# Altium project CH32V307VCT6.PrjPcb
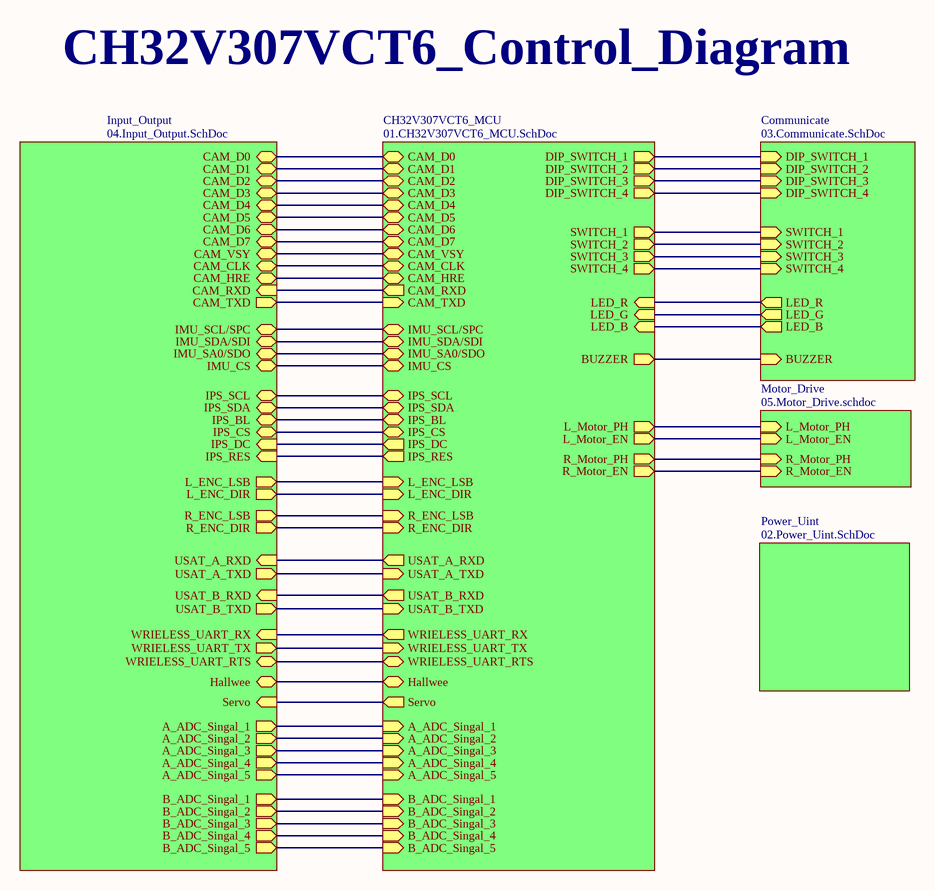
[diagram p0: 00.CH32V307VCT6.SchDoc]
6 sheets, 168 parts. Net scope: hierarchical (ports join the sheet entries above them; power ports are global).
Board file: CH32V307VCT6.PcbDoc
Sheets:
  00.CH32V307VCT6.SchDoc
    CH32V307VCT6_MCU = 01.CH32V307VCT6_MCU.SchDoc
    Communicate = 03.Communicate.SchDoc
    Input_Output = 04.Input_Output.SchDoc
    Power_Uint = 02.Power_Uint.SchDoc
    Motor_Drive = 05.Motor_Drive.schdoc

## Sheet 00.CH32V307VCT6.SchDoc: 00.CH32V307VCT6_Diagram
size A4; Organization: Altium Limited; Address1: L3, 12a Rodborough Rd; Address2: Frenchs Forest; Address3: NSW; Address4: Australia 2086; Revision: V1; SheetNumber: 1; SheetTotal: 6; Project: CH32V307VCT6

### Sub-sheets
CH32V307VCT6_MCU = 01.CH32V307VCT6_MCU.SchDoc: CAM_D0 (bidir), CAM_D1 (bidir), CAM_D2 (bidir), CAM_D3 (bidir), CAM_D5 (bidir), CAM_D4 (bidir), CAM_D6 (bidir), CAM_D7 (bidir), CAM_CLK (bidir), CAM_TXD (in), CAM_RXD (out), CAM_HRE (bidir), CAM_VSY (bidir), IMU_SCL/SPC (bidir), IMU_SDA/SDI (bidir), IMU_SA0/SDO (bidir), IMU_CS (bidir), IPS_SCL (bidir), IPS_RES (out), IPS_SDA (bidir), IPS_CS (bidir), IPS_BL (bidir), IPS_DC (out), L_ENC_LSB (in), L_ENC_DIR (in), R_ENC_LSB (in), R_ENC_DIR (in), DIP_SWITCH_1 (out), DIP_SWITCH_2 (out), DIP_SWITCH_3 (out), DIP_SWITCH_4 (out), SWITCH_1 (out), SWITCH_2 (out), SWITCH_3 (out), SWITCH_4 (out), LED_R (in), LED_G (in), LED_B (in), BUZZER (out), L_Motor_PH (out), L_Motor_EN (out), R_Motor_PH (out), R_Motor_EN (out), USAT_A_TXD (in), USAT_A_RXD (out), USAT_B_TXD (in), USAT_B_RXD (out), WRIELESS_UART_TX (in), WRIELESS_UART_RX (out), WRIELESS_UART_RTS (bidir), Hallwee (bidir), A_ADC_Singal_1 (in), A_ADC_Singal_2 (in), A_ADC_Singal_3 (in), A_ADC_Singal_4 (in), A_ADC_Singal_5 (in), B_ADC_Singal_1 (in), B_ADC_Singal_2 (in), B_ADC_Singal_3 (in), B_ADC_Singal_4 (in), B_ADC_Singal_5 (in), Servo (out)
Communicate = 03.Communicate.SchDoc: DIP_SWITCH_3 (in), DIP_SWITCH_4 (in), DIP_SWITCH_1 (in), DIP_SWITCH_2 (in), SWITCH_3 (in), SWITCH_4 (in), SWITCH_1 (in), SWITCH_2 (in), LED_R (out), LED_G (out), LED_B (out), BUZZER (in)
Input_Output = 04.Input_Output.SchDoc: CAM_D0 (bidir), CAM_D1 (bidir), CAM_D2 (bidir), CAM_D3 (bidir), CAM_D5 (bidir), CAM_D4 (bidir), CAM_D6 (bidir), CAM_D7 (bidir), IMU_SCL/SPC (bidir), CAM_CLK (bidir), CAM_TXD (out), CAM_RXD (in), CAM_HRE (bidir), CAM_VSY (bidir), IMU_SDA/SDI (bidir), IMU_SA0/SDO (bidir), IMU_CS (bidir), L_ENC_DIR (out), R_ENC_DIR (out), R_ENC_LSB (out), IPS_SCL (bidir), L_ENC_LSB (out), IPS_RES (in), IPS_SDA (bidir), IPS_CS (bidir), IPS_BL (bidir), IPS_DC (in), USAT_A_RXD (in), USAT_A_TXD (out), USAT_B_RXD (in), USAT_B_TXD (out), WRIELESS_UART_RX (in), WRIELESS_UART_TX (out), WRIELESS_UART_RTS (bidir), Hallwee (bidir), A_ADC_Singal_1 (out), A_ADC_Singal_2 (out), A_ADC_Singal_3 (out), A_ADC_Singal_4 (out), A_ADC_Singal_5 (out), B_ADC_Singal_1 (out), B_ADC_Singal_2 (out), B_ADC_Singal_3 (out), B_ADC_Singal_4 (out), B_ADC_Singal_5 (out), Servo (in)
Motor_Drive = 05.Motor_Drive.schdoc: L_Motor_PH (in), L_Motor_EN (in), R_Motor_PH (in), R_Motor_EN (in)
Power_Uint = 02.Power_Uint.SchDoc: no entries

### Nets
ADC0_PA0: sheet CH32V307VCT6_MCU/B_ADC_Singal_2, sheet Input_Output/B_ADC_Singal_2
ADC1_PA1: sheet CH32V307VCT6_MCU/B_ADC_Singal_1, sheet Input_Output/B_ADC_Singal_1
ADC7_PA7: sheet CH32V307VCT6_MCU/A_ADC_Singal_5, sheet Input_Output/A_ADC_Singal_5
ADC8_PB0: sheet CH32V307VCT6_MCU/A_ADC_Singal_2, sheet Input_Output/A_ADC_Singal_2
ADC9_PB1: sheet CH32V307VCT6_MCU/A_ADC_Singal_1, sheet Input_Output/A_ADC_Singal_1
ADC11_PC1: sheet CH32V307VCT6_MCU/B_ADC_Singal_5, sheet Input_Output/B_ADC_Singal_5
ADC12_PC2: sheet CH32V307VCT6_MCU/B_ADC_Singal_3, sheet Input_Output/B_ADC_Singal_3
ADC13_PC3: sheet CH32V307VCT6_MCU/B_ADC_Singal_4, sheet Input_Output/B_ADC_Singal_4
ADC14_PC4: sheet CH32V307VCT6_MCU/A_ADC_Singal_4, sheet Input_Output/A_ADC_Singal_4
ADC15_PC5: sheet CH32V307VCT6_MCU/A_ADC_Singal_3, sheet Input_Output/A_ADC_Singal_3
BUZZER_PE1: sheet CH32V307VCT6_MCU/BUZZER, sheet Communicate/BUZZER
CAM_PA4: sheet CH32V307VCT6_MCU/CAM_HRE, sheet Input_Output/CAM_HRE
CAM_PA5: sheet CH32V307VCT6_MCU/CAM_VSY, sheet Input_Output/CAM_VSY
CAM_PA6: sheet CH32V307VCT6_MCU/CAM_CLK, sheet Input_Output/CAM_CLK
CAM_PA9: sheet CH32V307VCT6_MCU/CAM_D0, sheet Input_Output/CAM_D0
CAM_PA10: sheet CH32V307VCT6_MCU/CAM_D1, sheet Input_Output/CAM_D1
CAM_PB6: sheet CH32V307VCT6_MCU/CAM_D5, sheet Input_Output/CAM_D5
CAM_PB8: sheet CH32V307VCT6_MCU/CAM_D6, sheet Input_Output/CAM_D6
CAM_PB9: sheet CH32V307VCT6_MCU/CAM_D7, sheet Input_Output/CAM_D7
CAM_PC8: sheet CH32V307VCT6_MCU/CAM_D2, sheet Input_Output/CAM_D2
CAM_PC9: sheet CH32V307VCT6_MCU/CAM_D3, sheet Input_Output/CAM_D3
CAM_PC11: sheet CH32V307VCT6_MCU/CAM_D4, sheet Input_Output/CAM_D4
DIP_SWITCH_PE7: sheet CH32V307VCT6_MCU/DIP_SWITCH_2, sheet Communicate/DIP_SWITCH_2
DIP_SWITCH_PE8: sheet CH32V307VCT6_MCU/DIP_SWITCH_3, sheet Communicate/DIP_SWITCH_3
DIP_SWITCH_PE10: sheet CH32V307VCT6_MCU/DIP_SWITCH_4, sheet Communicate/DIP_SWITCH_4
DIP_SWITCH_PE12: sheet CH32V307VCT6_MCU/DIP_SWITCH_1, sheet Communicate/DIP_SWITCH_1
Hallwee_PD3: sheet CH32V307VCT6_MCU/Hallwee, sheet Input_Output/Hallwee
IMU_PB3: sheet CH32V307VCT6_MCU/IMU_SCL/SPC, sheet Input_Output/IMU_SCL/SPC
IMU_PB4: sheet CH32V307VCT6_MCU/IMU_SA0/SDO, sheet Input_Output/IMU_SA0/SDO
IMU_PB5: sheet CH32V307VCT6_MCU/IMU_SDA/SDI, sheet Input_Output/IMU_SDA/SDI
IMU_PE4: sheet CH32V307VCT6_MCU/IMU_CS, sheet Input_Output/IMU_CS
IPS_PB7: sheet CH32V307VCT6_MCU/IPS_RES, sheet Input_Output/IPS_RES
IPS_PB13: sheet CH32V307VCT6_MCU/IPS_SCL, sheet Input_Output/IPS_SCL
IPS_PB15: sheet CH32V307VCT6_MCU/IPS_SDA, sheet Input_Output/IPS_SDA
IPS_PD0: sheet CH32V307VCT6_MCU/IPS_BL, sheet Input_Output/IPS_BL
IPS_PD4: sheet CH32V307VCT6_MCU/IPS_CS, sheet Input_Output/IPS_CS
IPS_PD7: sheet CH32V307VCT6_MCU/IPS_DC, sheet Input_Output/IPS_DC
L_EN_PD14: sheet CH32V307VCT6_MCU/L_Motor_PH, sheet Motor_Drive/L_Motor_PH
L_ENC_PA2: sheet CH32V307VCT6_MCU/L_ENC_LSB, sheet Input_Output/L_ENC_LSB
L_ENC_PA3: sheet CH32V307VCT6_MCU/L_ENC_DIR, sheet Input_Output/L_ENC_DIR
L_PH_PD13: sheet CH32V307VCT6_MCU/L_Motor_EN, sheet Motor_Drive/L_Motor_EN
LED_B_PB10: sheet CH32V307VCT6_MCU/LED_B, sheet Communicate/LED_B
LED_G_PB11: sheet CH32V307VCT6_MCU/LED_G, sheet Communicate/LED_G
LED_R_PB12: sheet CH32V307VCT6_MCU/LED_R, sheet Communicate/LED_R
R_EN_PD12: sheet CH32V307VCT6_MCU/R_Motor_PH, sheet Motor_Drive/R_Motor_PH
R_ENC_PE9: sheet CH32V307VCT6_MCU/R_ENC_LSB, sheet Input_Output/R_ENC_LSB
R_ENC_PE11: sheet CH32V307VCT6_MCU/R_ENC_DIR, sheet Input_Output/R_ENC_DIR
R_PH_PD11: sheet CH32V307VCT6_MCU/R_Motor_EN, sheet Motor_Drive/R_Motor_EN
Servo_PD15: sheet CH32V307VCT6_MCU/Servo, sheet Input_Output/Servo
SWITCH_PE2: sheet CH32V307VCT6_MCU/SWITCH_1, sheet Communicate/SWITCH_1
SWITCH_PE3: sheet CH32V307VCT6_MCU/SWITCH_2, sheet Communicate/SWITCH_2
SWITCH_PE5: sheet CH32V307VCT6_MCU/SWITCH_3, sheet Communicate/SWITCH_3
SWITCH_PE6: sheet CH32V307VCT6_MCU/SWITCH_4, sheet Communicate/SWITCH_4
UART2_RX_PD6: sheet CH32V307VCT6_MCU/USAT_A_TXD, sheet Input_Output/USAT_A_TXD
UART2_TX_PD5: sheet CH32V307VCT6_MCU/USAT_A_RXD, sheet Input_Output/USAT_A_RXD
UART3_RTS_B14: sheet CH32V307VCT6_MCU/WRIELESS_UART_RTS, sheet Input_Output/WRIELESS_UART_RTS
UART3_RX_D9: sheet CH32V307VCT6_MCU/WRIELESS_UART_TX, sheet Input_Output/WRIELESS_UART_TX
UART3_TX_D8: sheet CH32V307VCT6_MCU/WRIELESS_UART_RX, sheet Input_Output/WRIELESS_UART_RX
UART5_RX_PD2: sheet CH32V307VCT6_MCU/CAM_TXD, sheet Input_Output/CAM_TXD
UART5_TX_PC12: sheet CH32V307VCT6_MCU/CAM_RXD, sheet Input_Output/CAM_RXD
UART8_RX_PE15: sheet CH32V307VCT6_MCU/USAT_B_TXD, sheet Input_Output/USAT_B_TXD
UART8_TX_PE14: sheet CH32V307VCT6_MCU/USAT_B_RXD, sheet Input_Output/USAT_B_RXD

### Notes on the sheet
- CH32V307VCT6_Control_Diagram
- Title：
- Size:
- Project：
- A4
- Date:
- Revision:
- Author：
- Haibara
- Sheet:
- of:

## Sheet 01.CH32V307VCT6_MCU.SchDoc: 01.CH32V307VCT6_MCU
size A3; Organization: Altium Limited; Address1: L3, 12a Rodborough Rd; Address2: Frenchs Forest; Address3: NSW; Address4: Australia 2086; Revision: V1; SheetNumber: 2; SheetTotal: 6; Project: CH32V307VCT6
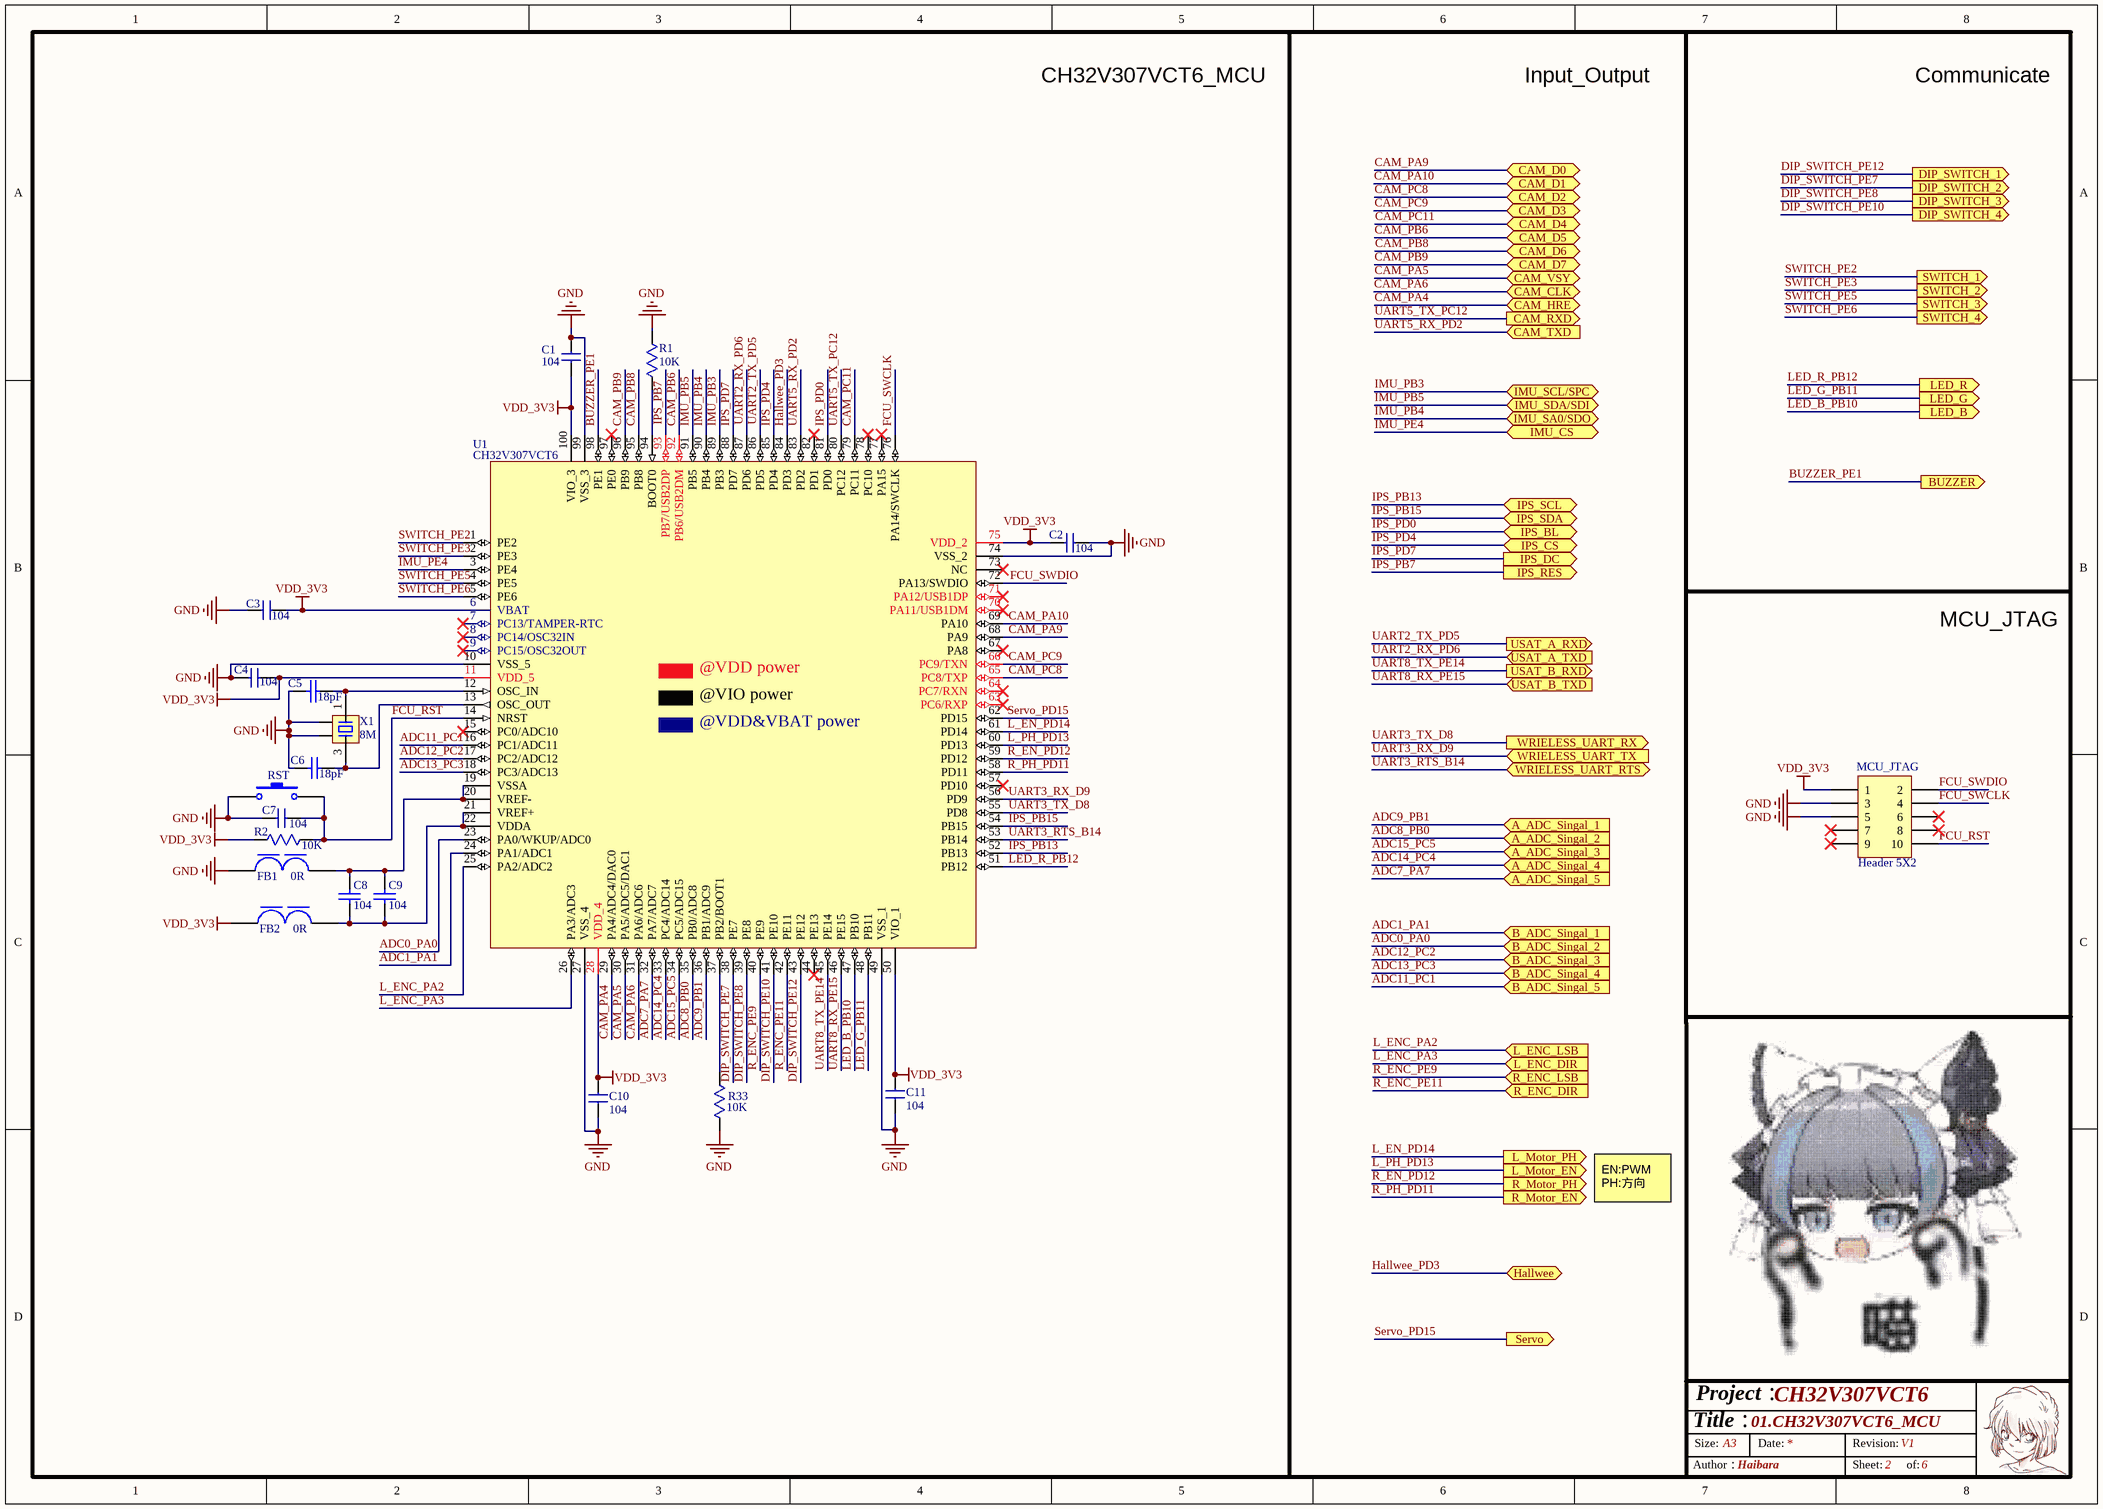
[diagram p1: 01.CH32V307VCT6_MCU.SchDoc]

### Parts
C1  104  [C0603]
C2  104  [C0603]
C3  104  [C0603]
C4  104  [C0603]
C5  18pF  [0603 电容 C3]
C6  18pF  [0603 电容 C3]
C7  104  [C0603]
C8  104  [0603 电容 C3]
C9  104  [0603 电容 C3]
C10  104  [C0603]
C11  104  [C0603]
FB1  0R  [0805 磁珠 FB3]
FB2  0R  [0805 磁珠 FB3]
MCU_JTAG  Header 5X2  [DC-2.54-L-Z-10P]
R1  10K  [R0603]
R2  10K  [R0603]
R33  10K  [R0603]
RST  SW-PB  [TSW SMD-3*6*2.5]  (value not drawn)
U1  CH32V307VCT6  [LQFP100]
X1  8M  [OSC 3225-4P]

### Ports
A_ADC_Singal_1 (in), A_ADC_Singal_2 (in), A_ADC_Singal_3 (in), A_ADC_Singal_4 (in), A_ADC_Singal_5 (in), B_ADC_Singal_1 (in), B_ADC_Singal_2 (in), B_ADC_Singal_3 (in), B_ADC_Singal_4 (in), B_ADC_Singal_5 (in), BUZZER (out), CAM_CLK (bidir), CAM_D0 (bidir), CAM_D1 (bidir), CAM_D2 (bidir), CAM_D3 (bidir), CAM_D4 (bidir), CAM_D5 (bidir), CAM_D6 (bidir), CAM_D7 (bidir), CAM_HRE (bidir), CAM_RXD (out), CAM_TXD (in), CAM_VSY (bidir), DIP_SWITCH_1 (out), DIP_SWITCH_2 (out), DIP_SWITCH_3 (out), DIP_SWITCH_4 (out), Hallwee (bidir), IMU_CS (bidir), IMU_SA0/SDO (bidir), IMU_SCL/SPC (bidir), IMU_SDA/SDI (bidir), IPS_BL (bidir), IPS_CS (bidir), IPS_DC (out), IPS_RES (out), IPS_SCL (bidir), IPS_SDA (bidir), L_ENC_DIR (in), L_ENC_LSB (in), L_Motor_EN (out), L_Motor_PH (out), LED_B (out), LED_G (out), LED_R (out), R_ENC_DIR (in), R_ENC_LSB (in), R_Motor_EN (out), R_Motor_PH (out), Servo (out), SWITCH_1 (out), SWITCH_2 (out), SWITCH_3 (out), SWITCH_4 (out), USAT_A_RXD (out), USAT_A_TXD (in), USAT_B_RXD (out), USAT_B_TXD (in), WRIELESS_UART_RTS (bidir), WRIELESS_UART_RX (out), WRIELESS_UART_TX (in)

### Nets
GND: C1.2 C2.2 C3.1 C4.2 C5.1 C6.2 C7.1 C10.2 C11.2 FB1.1 MCU_JTAG.3 MCU_JTAG.5 R1.1 R33.1 RST.1 U1.10(VSS_5) U1.27(VSS_4) U1.49(VSS_1) U1.74(VSS_2) U1.99(VSS_3) X1.2 X1.4
VDD_3V3: C1.1 C2.1 C3.2 C4.1 C10.1 C11.1 FB2.1 MCU_JTAG.1 R2.1 U1.6(VBAT) U1.11(VDD_5) U1.28(VDD_4) U1.50(VIO_1) U1.75(VDD_2) U1.100(VIO_3)
ADC0_PA0: U1.23(PA0/WKUP/ADC0) ; port B_ADC_Singal_2
ADC1_PA1: U1.24(PA1/ADC1) ; port B_ADC_Singal_1
ADC7_PA7: U1.32(PA7/ADC7) ; port A_ADC_Singal_5
ADC8_PB0: U1.35(PB0/ADC8) ; port A_ADC_Singal_2
ADC9_PB1: U1.36(PB1/ADC9) ; port A_ADC_Singal_1
ADC11_PC1: U1.16(PC1/ADC11) ; port B_ADC_Singal_5
ADC12_PC2: U1.17(PC2/ADC12) ; port B_ADC_Singal_3
ADC13_PC3: U1.18(PC3/ADC13) ; port B_ADC_Singal_4
ADC14_PC4: U1.33(PC4/ADC14) ; port A_ADC_Singal_4
ADC15_PC5: U1.34(PC5/ADC15) ; port A_ADC_Singal_3
BUZZER_PE1: U1.98(PE1) ; port BUZZER
CAM_PA4: U1.29(PA4/ADC4/DAC0) ; port CAM_HRE
CAM_PA5: U1.30(PA5/ADC5/DAC1) ; port CAM_VSY
CAM_PA6: U1.31(PA6/ADC6) ; port CAM_CLK
CAM_PA9: U1.68(PA9) ; port CAM_D0
CAM_PA10: U1.69(PA10) ; port CAM_D1
CAM_PB6: U1.92(PB6/USB2DM) ; port CAM_D5
CAM_PB8: U1.95(PB8) ; port CAM_D6
CAM_PB9: U1.96(PB9) ; port CAM_D7
CAM_PC8: U1.65(PC8/TXP) ; port CAM_D2
CAM_PC9: U1.66(PC9/TXN) ; port CAM_D3
CAM_PC11: U1.79(PC11) ; port CAM_D4
DIP_SWITCH_PE7: U1.38(PE7) ; port DIP_SWITCH_2
DIP_SWITCH_PE8: U1.39(PE8) ; port DIP_SWITCH_3
DIP_SWITCH_PE10: U1.41(PE10) ; port DIP_SWITCH_4
DIP_SWITCH_PE12: U1.43(PE12) ; port DIP_SWITCH_1
FCU_RST: C7.2 MCU_JTAG.10 R2.2 RST.2 U1.14(NRST)
FCU_SWCLK: MCU_JTAG.4 U1.76(PA14/SWCLK)
FCU_SWDIO: MCU_JTAG.2 U1.72(PA13/SWDIO)
Hallwee_PD3: U1.84(PD3) ; port Hallwee
IMU_PB3: U1.89(PB3) ; port IMU_SCL/SPC
IMU_PB4: U1.90(PB4) ; port IMU_SA0/SDO
IMU_PB5: U1.91(PB5) ; port IMU_SDA/SDI
IMU_PE4: U1.3(PE4) ; port IMU_CS
IPS_PB7: U1.93(PB7/USB2DP) ; port IPS_RES
IPS_PB13: U1.52(PB13) ; port IPS_SCL
IPS_PB15: U1.54(PB15) ; port IPS_SDA
IPS_PD0: U1.81(PD0) ; port IPS_BL
IPS_PD4: U1.85(PD4) ; port IPS_CS
IPS_PD7: U1.88(PD7) ; port IPS_DC
L_EN_PD14: U1.61(PD14) ; port L_Motor_PH
L_ENC_PA2: U1.25(PA2/ADC2) ; port L_ENC_LSB
L_ENC_PA3: U1.26(PA3/ADC3) ; port L_ENC_DIR
L_PH_PD13: U1.60(PD13) ; port L_Motor_EN
LED_B_PB10: U1.47(PB10) ; port LED_B
LED_G_PB11: U1.48(PB11) ; port LED_G
LED_R_PB12: U1.51(PB12) ; port LED_R
R_EN_PD12: U1.59(PD12) ; port R_Motor_PH
R_ENC_PE9: U1.40(PE9) ; port R_ENC_LSB
R_ENC_PE11: U1.42(PE11) ; port R_ENC_DIR
R_PH_PD11: U1.58(PD11) ; port R_Motor_EN
Servo_PD15: U1.62(PD15) ; port Servo
SWITCH_PE2: U1.1(PE2) ; port SWITCH_1
SWITCH_PE3: U1.2(PE3) ; port SWITCH_2
SWITCH_PE5: U1.4(PE5) ; port SWITCH_3
SWITCH_PE6: U1.5(PE6) ; port SWITCH_4
UART2_RX_PD6: U1.87(PD6) ; port USAT_A_TXD
UART2_TX_PD5: U1.86(PD5) ; port USAT_A_RXD
UART3_RTS_B14: U1.53(PB14) ; port WRIELESS_UART_RTS
UART3_RX_D9: U1.56(PD9) ; port WRIELESS_UART_TX
UART3_TX_D8: U1.55(PD8) ; port WRIELESS_UART_RX
UART5_RX_PD2: U1.83(PD2) ; port CAM_TXD
UART5_TX_PC12: U1.80(PC12) ; port CAM_RXD
UART8_RX_PE15: U1.46(PE15) ; port USAT_B_TXD
UART8_TX_PE14: U1.45(PE14) ; port USAT_B_RXD
NetC5_2: C5.2 U1.12(OSC_IN) X1.1
NetC6_1: C6.1 U1.13(OSC_OUT) X1.3
NetC8_1: C8.1 C9.1 FB1.2 U1.19(VSSA) U1.20(VREF-)
NetC8_2: C8.2 C9.2 FB2.2 U1.21(VREF+) U1.22(VDDA)
NetR1_2: R1.2 U1.94(BOOT0)
NetR33_2: R33.2 U1.37(PB2/BOOT1)

Not connected (* = marked no-connect by the designer): MCU_JTAG 6* 7* 8* 9*; U1 7(PC13/TAMPER-RTC)* 8(PC14/OSC32IN)* 9(PC15/OSC32OUT)* 15(PC0/ADC10)* 44(PE13)* 57(PD10)* 63(PC6/RXP)* 64(PC7/RXN)* 67(PA8)* 70(PA11/USB1DM)* 71(PA12/USB1DP)* 73(NC)* 77(PA15)* 78(PC10)* 82(PD1)* 97(PE0)*

### Notes on the sheet
- CH32V307VCT6_MCU
- Input_Output
- Communicate
- MCU_JTAG
- EN:PWM
  PH:方向
- Title：
- Size:
- Project：
- A3
- Date:
- Revision:
- Author：
- Haibara
- Sheet:
- of:
- (in symbol CH32V307V) @VDD power; @VIO power; @VDD&VBAT power

### Library data of the parts
C1-C4 C7 C10 C11 = 电容
C5 C6 C8 C9 = Cap: Capacitor; Published: 8-Jun-2000; LatestRevisionDate: 17-Jul-2002; LatestRevisionNote: Re-released for DXP Platform.; PackageReference: RAD-0.3; Publisher: Altium Limited; PackageDescription: Radial Cap, Thru-Hole; 2 Leads; 0.3 in Pin Spacing
FB1 FB2 = FB
MCU_JTAG = Header 5X2: Header, 5-Pin, Dual row; LatestRevisionDate: 17-Jul-2002; LatestRevisionNote: Re-released for DXP Platform.; Publisher: Altium Limited
R1 R2 R33 = 电阻
RST = SW-PB: Switch; Published: 24-Mar-1999; LatestRevisionDate: 17-Jul-2002; LatestRevisionNote: Re-released for DXP Platform.; PackageReference: SPST-2; Publisher: Altium Limited; PackageDescription: Switch; 2 Leads
U1 = CH32V307V: RISC-V FPU HD-MCU, 144MHz, USB_480M, USB OTG, 1000M Ethernet MAC, 2*CAN, FSMC+DVP
X1 = XTAL-4P: 4脚无源晶振; 版权归属: 源创客; BOM名称: 4脚无源晶振; 学习资源: www.ooocke.com

## Sheet 03.Communicate.SchDoc: 03.Communicate
size A4; Organization: Altium Limited; Address1: L3, 12a Rodborough Rd; Address2: Frenchs Forest; Address3: NSW; Address4: Australia 2086; Revision: V1; SheetNumber: 4; SheetTotal: 6; Project: CH32V307VCT6
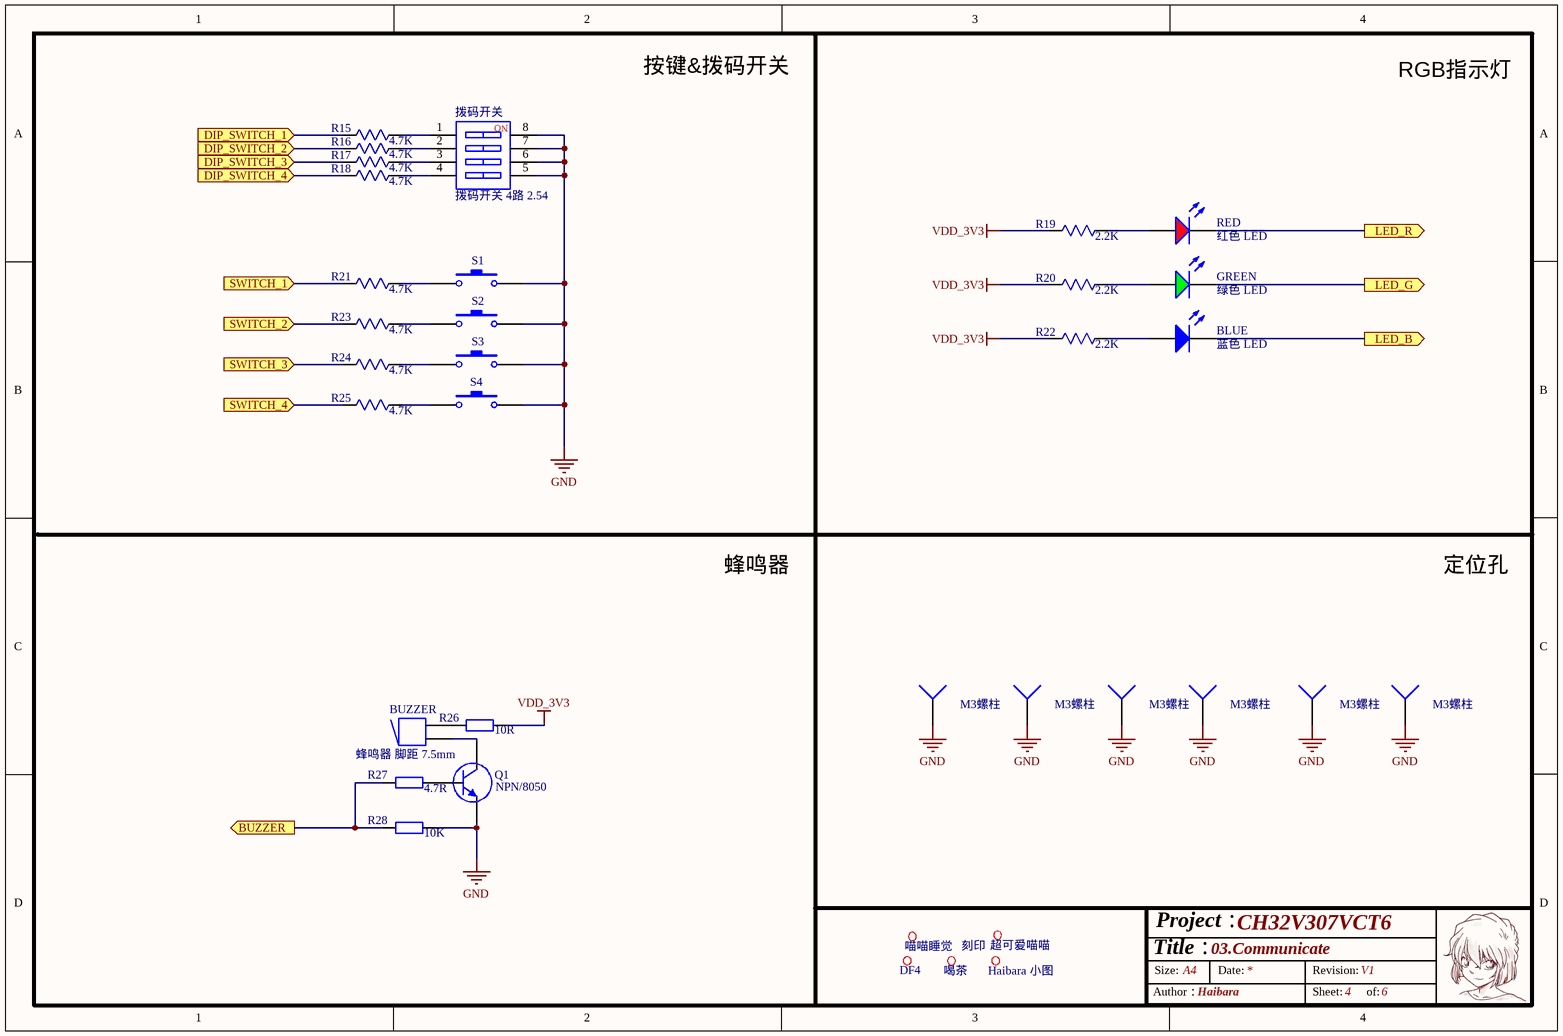
[diagram p2: 03.Communicate.SchDoc]

### Parts
(Parts that share a designator on the sheet are numbered #1, #2 ... from top to bottom, then left to right.)
?#1  喵喵睡觉  [喵喵睡觉]
?#2  超可爱喵喵  [喵喵]
?#3  刻印  [刻印]
?#4  DF4  [DF4小]
?#5  Haibara 小图  [Haibara小图丝印]
?#6  喝茶  [喝茶]
BLUE  蓝色 LED  [0603 LED B]
BUZZER  蜂鸣器 脚距 7.5mm  [蜂鸣器5.5mm脚距]
GREEN  绿色 LED  [0603 LED G]
J1  M3螺柱  [MTGP720H320V6P - duplicate]
J2  M3螺柱  [MTGP720H320V6P - duplicate]
J3  M3螺柱  [MTGP720H320V6P - duplicate]
J4  M3螺柱  [MTGP720H320V6P - duplicate]
J5  M3螺柱  [MTGP720H320V6P - duplicate]
J6  M3螺柱  [MTGP720H320V6P - duplicate]
Q1  NPN/8050  [SOT232-3 三极管]
R15  4.7K  [R0603]
R16  4.7K  [R0603]
R17  4.7K  [R0603]
R18  4.7K  [R0603]
R19  2.2K  [R0603]
R20  2.2K  [R0603]
R21  4.7K  [R0603]
R22  2.2K  [R0603]
R23  4.7K  [R0603]
R24  4.7K  [R0603]
R25  4.7K  [R0603]
R26  value 10R  [0603 电阻 R3]  (hidden comment: 4.7K)
R27  value 4.7R  [0603 电阻 R3]  (hidden comment: 4.7K)
R28  value 10K  [0603 电阻 R3]  (hidden comment: 4.7K)
RED  红色 LED  [0603 LED R]
S1  SW-PB  [TSW SMD-3*6*2.5]  (value not drawn)
S2  SW-PB  [TSW SMD-3*6*2.5]  (value not drawn)
S3  SW-PB  [TSW SMD-3*6*2.5]  (value not drawn)
S4  SW-PB  [TSW SMD-3*6*2.5]  (value not drawn)
拨码开关  拨码开关 4路 2.54  [CSW DIP-2P_G]

### Ports
BUZZER (out), DIP_SWITCH_1 (in), DIP_SWITCH_2 (in), DIP_SWITCH_3 (in), DIP_SWITCH_4 (in), LED_B (out), LED_G (out), LED_R (out), SWITCH_1 (in), SWITCH_2 (in), SWITCH_3 (in), SWITCH_4 (in)

### Nets
GND: J1.1 J2.1 J3.1 J4.1 J5.1 J6.1 Q1.2(E) R28.2 S1.2 S2.2 S3.2 S4.2 拨码开关.5 拨码开关.6 拨码开关.7 拨码开关.8
VDD_3V3: R19.1 R20.1 R22.1 R26.2
BUZZER_PE1: R27.1 R28.1 ; port BUZZER
DIP_SWITCH_PE7: R16.1 ; port DIP_SWITCH_2
DIP_SWITCH_PE8: R17.1 ; port DIP_SWITCH_3
DIP_SWITCH_PE10: R18.1 ; port DIP_SWITCH_4
DIP_SWITCH_PE12: R15.1 ; port DIP_SWITCH_1
LED_B_PB10: BLUE.2 ; port LED_B
LED_G_PB11: GREEN.2 ; port LED_G
LED_R_PB12: RED.2 ; port LED_R
SWITCH_PE2: R21.1 ; port SWITCH_1
SWITCH_PE3: R23.1 ; port SWITCH_2
SWITCH_PE5: R24.1 ; port SWITCH_3
SWITCH_PE6: R25.1 ; port SWITCH_4
NetBLUE_1: BLUE.1 R22.2
NetBUZZER_1: BUZZER.1 R26.1
NetBUZZER_2: BUZZER.2 Q1.3(C)
NetGREEN_1: GREEN.1 R20.2
NetQ1_1: Q1.1(B) R27.2
NetR15_2: R15.2 拨码开关.1
NetR16_2: R16.2 拨码开关.2
NetR17_2: R17.2 拨码开关.3
NetR18_2: R18.2 拨码开关.4
NetR19_2: R19.2 RED.1
NetR21_2: R21.2 S1.1
NetR23_2: R23.2 S2.1
NetR24_2: R24.2 S3.1
NetR25_2: R25.2 S4.1

### Notes on the sheet
- 按键&拨码开关
- RGB指示灯
- 蜂鸣器
- 定位孔
- Title：
- Size:
- Project：
- A4
- Date:
- Revision:
- Author：
- Haibara
- Sheet:
- of:
- (in symbol CSW-4P) NO

### Library data of the parts
BLUE = 蓝灯: 发光二极管; ComponentLink1Description: 供应商链接; ComponentLink1URL: http://www.szlcsc.com/product/details_2666.html; Package: 0805; Supplier: LC; SuppliersPartNumber: C2293
BUZZER = Buzzer: Magnetic Transducer Buzzer; Published: 24-Mar-1999; LatestRevisionDate: 17-Dec-2003; LatestRevisionNote: Schematic revised, PCB Footprint replaced.; DatasheetVersion: 17-Dec-2003; PackageReference: ABSM-1574; Publisher: Altium Limited; PackageDescription: Magnetic Transducer Buzzer; ComponentLink1Description: Manufacturer Link; ComponentLink1URL: http://www.megastar.com/linecard/buzzmode/index.php
GREEN = 绿灯: 发光二极管; ComponentLink1Description: 供应商链接; ComponentLink1URL: http://www.szlcsc.com/product/details_2670.html; Package: 0805; Supplier: LC; SuppliersPartNumber: C2297
J1-J6 = Socket: LatestRevisionDate: 17-Jul-2002; LatestRevisionNote: Re-released for DXP Platform.; Publisher: Altium Limited
R15-R25 = 电阻
R26-R28 = Res2: Resistor; Published: 8-Jun-2000; LatestRevisionDate: 17-Jul-2002; LatestRevisionNote: Re-released for DXP Platform.; PackageReference: AXIAL-0.4; Publisher: Altium Limited; PackageDescription: Axial Device, Thru-Hole; 2 Leads; 0.4 in Pin Spacing
RED = 红灯: 发光二极管; ComponentLink1Description: 供应商链接; ComponentLink1URL: http://www.szlcsc.com/product/details_2668.html; Package: 0805; Supplier: LC; SuppliersPartNumber: C2295
S1-S4 = SW-PB: Switch; Published: 24-Mar-1999; LatestRevisionDate: 17-Jul-2002; LatestRevisionNote: Re-released for DXP Platform.; PackageReference: SPST-2; Publisher: Altium Limited; PackageDescription: Switch; 2 Leads
拨码开关 = CSW-4P: 4路编码开关; 版权归属: 源创客; BOM名称: 4路编码开关; 学习资源: www.ooocke.com

## Sheet 04.Input_Output.SchDoc: 04.Input_Output
size A4; Organization: Altium Limited; Address1: L3, 12a Rodborough Rd; Address2: Frenchs Forest; Address3: NSW; Address4: Australia 2086; Revision: V1; SheetNumber: 5; SheetTotal: 6; Project: CH32V307VCT6
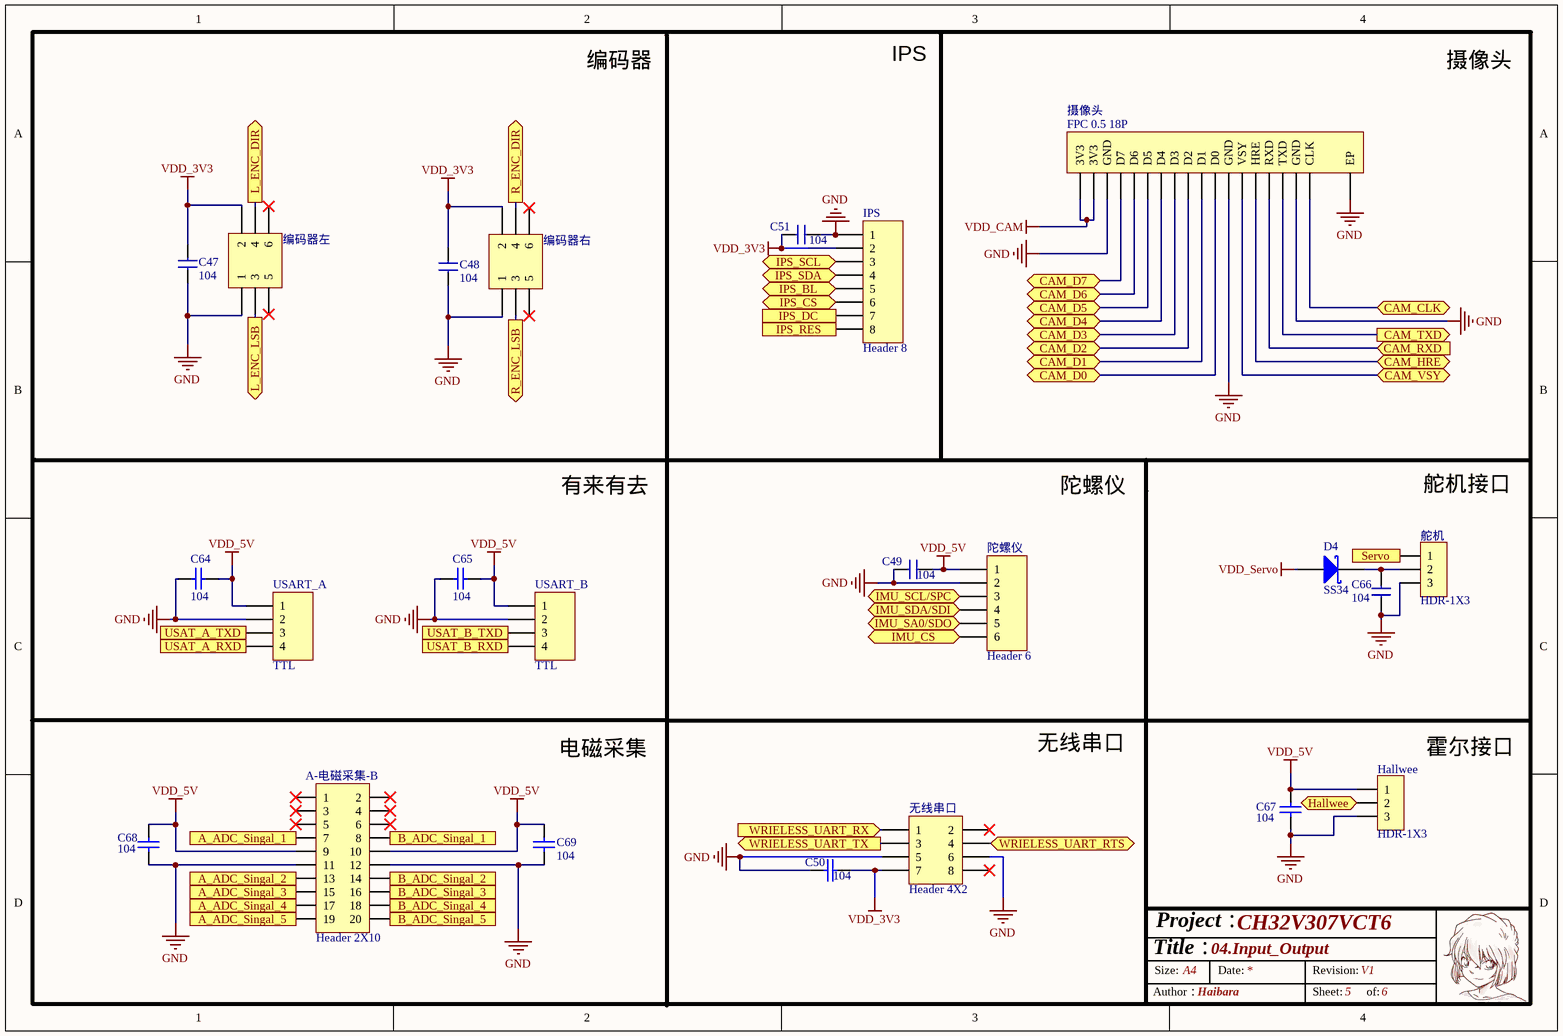
[diagram p3: 04.Input_Output.SchDoc]

### Parts
A-电磁采集-B  Header 2X10  [HDR2.54-LI-2x10P]
C47  104  [C0603]
C48  104  [C0603]
C49  104  [C0603]
C50  104  [0603 电容 C3]
C51  104  [C0603]
C64  104  [0603 电容 C3]
C65  104  [0603 电容 C3]
C66  104  [C0603]
C67  104  [0603 电容 C3]
C68  104  [0603 电容 C3]
C69  104  [0603 电容 C3]
D4  SS34  [SMA]
Hallwee  HDR-1X3  [HDR2.54-M-LI-3P]
IPS  Header 8  [HDR2.54-M-LI-8P]
USART_A  TTL  [HDR2.54-M-LI-4P]
USART_B  TTL  [HDR2.54-M-LI-4P]
摄像头  FPC 0.5 18P  [FPC0.5 2H-WS-18P]
无线串口  Header 4X2  [2.54mm 4P*2排母]
编码器右  Header 3X2  [DC-2.54-L-Z-6P]  (value not drawn)
编码器左  Header 3X2  [DC-2.54-L-Z-6P]  (value not drawn)
舵机  HDR-1X3  [HDR2.54-M-LI-3P]
陀螺仪  Header 6  [MX 1.25-WS-6P]

### Ports
A_ADC_Singal_1 (out), A_ADC_Singal_2 (out), A_ADC_Singal_3 (out), A_ADC_Singal_4 (out), A_ADC_Singal_5 (out), B_ADC_Singal_1 (out), B_ADC_Singal_2 (out), B_ADC_Singal_3 (out), B_ADC_Singal_4 (out), B_ADC_Singal_5 (out), CAM_CLK (bidir), CAM_D0 (bidir), CAM_D1 (bidir), CAM_D2 (bidir), CAM_D3 (bidir), CAM_D4 (bidir), CAM_D5 (bidir), CAM_D6 (bidir), CAM_D7 (bidir), CAM_HRE (bidir), CAM_RXD (in), CAM_TXD (out), CAM_VSY (bidir), Hallwee (bidir), IMU_CS (bidir), IMU_SA0/SDO (bidir), IMU_SCL/SPC (bidir), IMU_SDA/SDI (bidir), IPS_BL (bidir), IPS_CS (bidir), IPS_DC (in), IPS_RES (in), IPS_SCL (bidir), IPS_SDA (bidir), L_ENC_DIR (out), L_ENC_LSB (out), R_ENC_DIR (out), R_ENC_LSB (out), Servo (in), USAT_A_RXD (in), USAT_A_TXD (out), USAT_B_RXD (in), USAT_B_TXD (out), WRIELESS_UART_RTS (bidir), WRIELESS_UART_RX (in), WRIELESS_UART_TX (out)

### Nets
GND: A-电磁采集-B.11 A-电磁采集-B.12 C47.1 C48.1 C49.2 C50.2 C51.2 C64.2 C65.2 C66.1 C67.1 C68.1 C69.1 Hallwee.3 IPS.1 USART_A.2 USART_B.2 摄像头.0(EP) 摄像头.3(GND) 摄像头.12(GND) 摄像头.17(GND) 无线串口.5 无线串口.6 编码器右.1 编码器左.1 舵机.3 陀螺仪.2
VDD_3V3: C47.2 C48.2 C50.1 C51.1 IPS.2 无线串口.7 编码器右.2 编码器左.2
VDD_5V: A-电磁采集-B.9 A-电磁采集-B.10 C49.1 C64.1 C65.1 C67.2 C68.2 C69.2 Hallwee.1 USART_A.1 USART_B.1 陀螺仪.1
VDD_CAM: 摄像头.1(3V3) 摄像头.2(3V3)
VDD_Servo: D4.1(A)
ADC0_PA0: A-电磁采集-B.14 ; port B_ADC_Singal_2
ADC1_PA1: A-电磁采集-B.8 ; port B_ADC_Singal_1
ADC7_PA7: A-电磁采集-B.19 ; port A_ADC_Singal_5
ADC8_PB0: A-电磁采集-B.13 ; port A_ADC_Singal_2
ADC9_PB1: A-电磁采集-B.7 ; port A_ADC_Singal_1
ADC11_PC1: A-电磁采集-B.20 ; port B_ADC_Singal_5
ADC12_PC2: A-电磁采集-B.16 ; port B_ADC_Singal_3
ADC13_PC3: A-电磁采集-B.18 ; port B_ADC_Singal_4
ADC14_PC4: A-电磁采集-B.17 ; port A_ADC_Singal_4
ADC15_PC5: A-电磁采集-B.15 ; port A_ADC_Singal_3
CAM_PA4: 摄像头.14(HRE) ; port CAM_HRE
CAM_PA5: 摄像头.13(VSY) ; port CAM_VSY
CAM_PA6: 摄像头.18(CLK) ; port CAM_CLK
CAM_PA9: 摄像头.11(D0) ; port CAM_D0
CAM_PA10: 摄像头.10(D1) ; port CAM_D1
CAM_PB6: 摄像头.6(D5) ; port CAM_D5
CAM_PB8: 摄像头.5(D6) ; port CAM_D6
CAM_PB9: 摄像头.4(D7) ; port CAM_D7
CAM_PC8: 摄像头.9(D2) ; port CAM_D2
CAM_PC9: 摄像头.8(D3) ; port CAM_D3
CAM_PC11: 摄像头.7(D4) ; port CAM_D4
Hallwee_PD3: Hallwee.2 ; port Hallwee
IMU_PB3: 陀螺仪.3 ; port IMU_SCL/SPC
IMU_PB4: 陀螺仪.5 ; port IMU_SA0/SDO
IMU_PB5: 陀螺仪.4 ; port IMU_SDA/SDI
IMU_PE4: 陀螺仪.6 ; port IMU_CS
IPS_PB7: IPS.8 ; port IPS_RES
IPS_PB13: IPS.3 ; port IPS_SCL
IPS_PB15: IPS.4 ; port IPS_SDA
IPS_PD0: IPS.5 ; port IPS_BL
IPS_PD4: IPS.6 ; port IPS_CS
IPS_PD7: IPS.7 ; port IPS_DC
L_ENC_PA2: 编码器左.3 ; port L_ENC_LSB
L_ENC_PA3: 编码器左.4 ; port L_ENC_DIR
R_ENC_PE9: 编码器右.3 ; port R_ENC_LSB
R_ENC_PE11: 编码器右.4 ; port R_ENC_DIR
Servo_PD15: 舵机.1 ; port Servo
UART2_RX_PD6: USART_A.3 ; port USAT_A_TXD
UART2_TX_PD5: USART_A.4 ; port USAT_A_RXD
UART3_RTS_B14: 无线串口.4 ; port WRIELESS_UART_RTS
UART3_RX_D9: 无线串口.3 ; port WRIELESS_UART_TX
UART3_TX_D8: 无线串口.1 ; port WRIELESS_UART_RX
UART5_RX_PD2: 摄像头.16(TXD) ; port CAM_TXD
UART5_TX_PC12: 摄像头.15(RXD) ; port CAM_RXD
UART8_RX_PE15: USART_B.3 ; port USAT_B_TXD
UART8_TX_PE14: USART_B.4 ; port USAT_B_RXD
NetC66_2: C66.2 D4.2(K) 舵机.2

Not connected (* = marked no-connect by the designer): A-电磁采集-B 1* 2* 3* 4* 5* 6*; 无线串口 2* 8*; 编码器右 5* 6*; 编码器左 5* 6*

### Notes on the sheet
- Labels drawn without touching a wire or pin: IPS, 摄像头, 无线串口, 有来有去, 电磁采集, 编码器, 舵机接口, 陀螺仪, 霍尔接口
- Title：
- Size:
- Project：
- A4
- Date:
- Revision:
- Author：
- Haibara
- Sheet:
- of:

### Library data of the parts
A-电磁采集-B = Header 10X2: 10*2P接插件; 版权归属: 源创客; BOM名称: 10*2P接插件; 学习资源: www.ooocke.com
C47-C49 C51 C66 = 电容
C50 C64 C65 C67-C69 = Cap: Capacitor; Published: 8-Jun-2000; LatestRevisionDate: 17-Jul-2002; LatestRevisionNote: Re-released for DXP Platform.; PackageReference: RAD-0.3; Publisher: Altium Limited; PackageDescription: Radial Cap, Thru-Hole; 2 Leads; 0.3 in Pin Spacing
D4 = 肖特基二极管: Schottky Rectifier; Note: Terminal 2 is the TAB and is electrically connected to the cathode; Published: 8-Jun-2000; LatestRevisionDate: 17-Jul-2002; LatestRevisionNote: Re-released for DXP Platform.; DatasheetVersion: PD-2.057B; PackageVersion: Feb-1998; PackageReference: TO-220AC; Publisher: Altium Limited; PackageDescription: TO, Thru-Hole, Vertical, Heatsink Mounted; 3 In-Line Leads (1 Absent); Pitch 2.54 mm; ComponentLink1Description: Manufacturer Link; ComponentLink1URL: http://www.irf.com/; ComponentLink2Description: Datasheet; ComponentLink2URL: http://www.irf.com/product-info/datasheets/data/10tq.pdf
Hallwee 舵机 = Header 3: 3P接插件; 版权归属: 封装库来自淘宝 ID：黄晶宝石; BOM名称: 3P接插件; 学习资源: https://shop463601444.taobao.com
IPS = Header 8: Header, 8-Pin; LatestRevisionDate: 17-Jul-2002; LatestRevisionNote: Re-released for DXP Platform.; Publisher: Altium Limited
USART_A USART_B = Header 4: Header, 4-Pin; LatestRevisionDate: 17-Jul-2002; LatestRevisionNote: Re-released for DXP Platform.; Publisher: Altium Limited
摄像头 = 18P Cam: Header, 25-Pin; LatestRevisionDate: 17-Jul-2002; LatestRevisionNote: Re-released for DXP Platform.; Publisher: Altium Limited
无线串口 = Header 4X2: Header, 4-Pin, Dual row; LatestRevisionDate: 17-Jul-2002; LatestRevisionNote: Re-released for DXP Platform.; Publisher: Altium Limited
编码器右 编码器左 = Header 3X2: Header, 3-Pin, Dual row; LatestRevisionDate: 17-Jul-2002; LatestRevisionNote: Re-released for DXP Platform.; Publisher: Altium Limited
陀螺仪 = Header 6: Header, 6-Pin; LatestRevisionDate: 17-Jul-2002; LatestRevisionNote: Re-released for DXP Platform.; Publisher: Altium Limited

## Sheet 02.Power_Uint.SchDoc: 02.Power_Uint
size A4; Organization: Altium Limited; Address1: L3, 12a Rodborough Rd; Address2: Frenchs Forest; Address3: NSW; Address4: Australia 2086; Revision: V1; SheetNumber: 3; SheetTotal: 6; Project: CH32V307VCT6
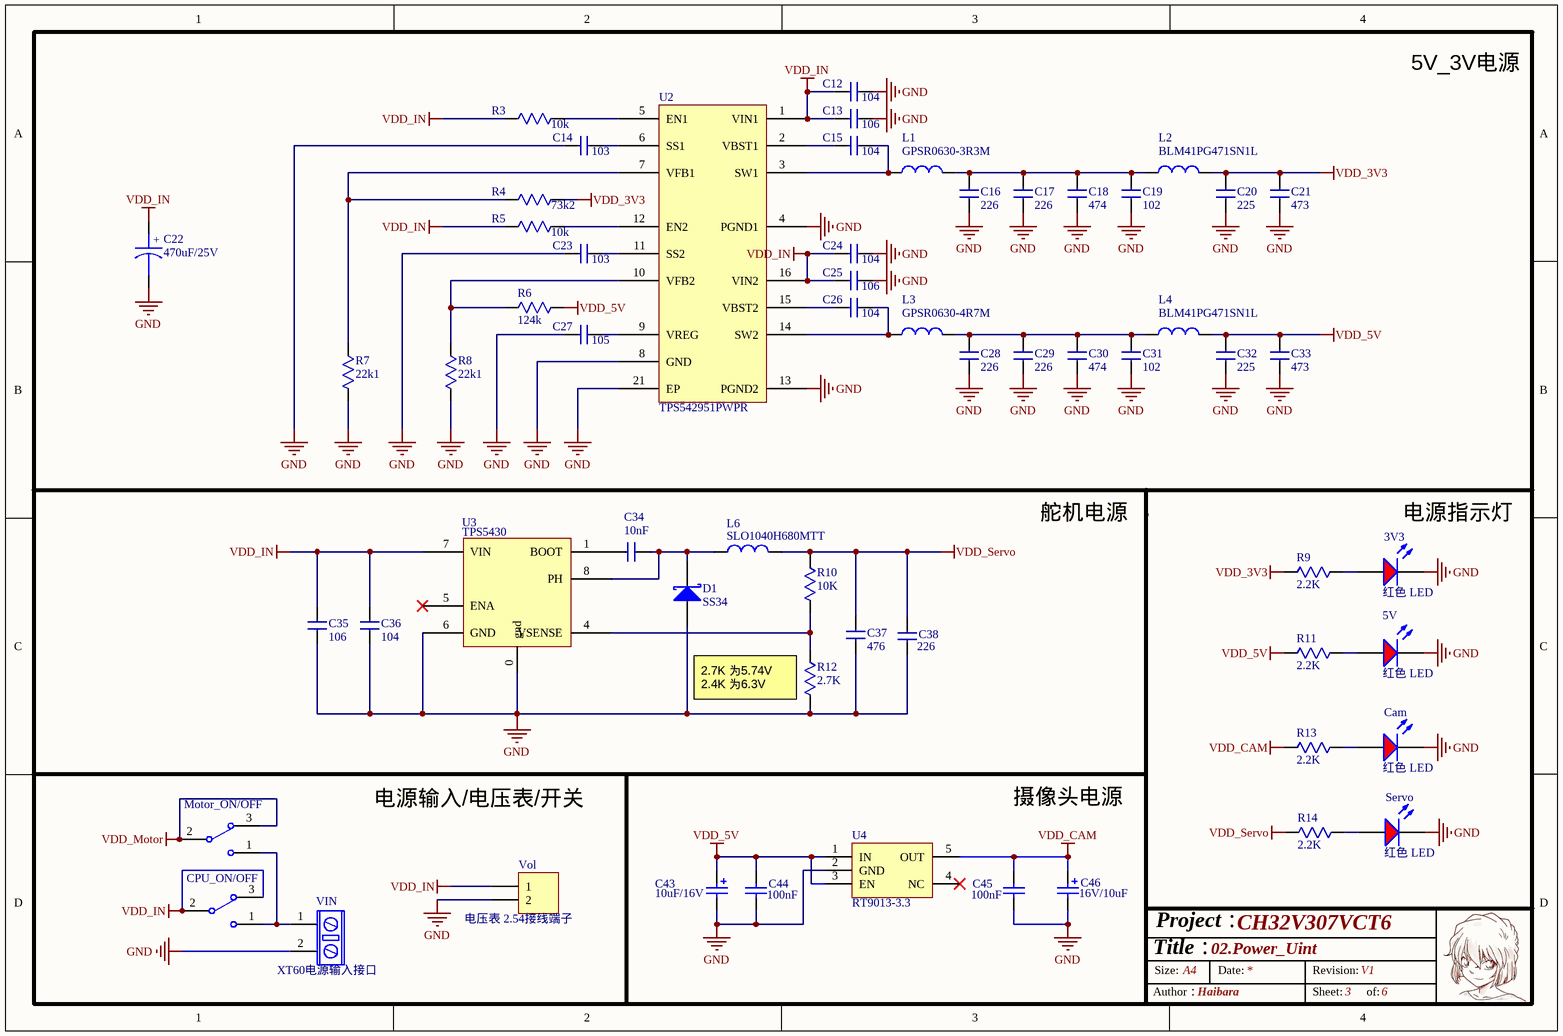
[diagram p4: 02.Power_Uint.SchDoc]

### Parts
3V3  红色 LED  [0603 LED R]
5V  红色 LED  [0603 LED R]
C12  104  [C0603]
C13  106  [C0805]
C14  103  [C0603]
C15  104  [C0805]
C16  226  [C0805]
C17  226  [C0805]
C18  474  [C0603]
C19  102  [C0603]
C20  225  [C0603]
C21  473  [C0603]
C22  470uF/25V  [CAP 2.5*6.3*11.2]
C23  103  [C0603]
C24  104  [C0603]
C25  106  [C0805]
C26  104  [C0805]
C27  105  [C0603]
C28  226  [C0805]
C29  226  [C0805]
C30  474  [C0603]
C31  102  [C0603]
C32  225  [C0603]
C33  473  [C0603]
C34  10nF  [C0603]
C35  106  [C0805]
C36  104  [C0603]
C37  476  [C0805]
C38  226  [C0805]
C43  10UF  [C0805]  (value not drawn)
C44  100nF  [0603 电容 C3]
C45  100nF  [0603 电容 C3]
C46  value 16V/10uF  [C0805]  (hidden comment: 10UF)
Cam  红色 LED  [0603 LED R]
CPU_ON/OFF  SW-SPDT  [MTS-102S 两档纽子开关]  (value not drawn)
D1  SS34  [SMA]
L1  GPSR0630-3R3M  [L 0630]
L2  BLM41PG471SN1L  [R1206]
L3  GPSR0630-4R7M  [L 0630]
L4  BLM41PG471SN1L  [R1206]
L6  SLO1040H680MTT  [IND-SMD_L10.8-W10.0]
Motor_ON/OFF  SW-SPDT  [MTS-102S 两档纽子开关]  (value not drawn)
R3  10k  [R0603]
R4  73k2  [R0603]
R5  10k  [R0603]
R6  124k  [R0603]
R7  22k1  [R0603]
R8  22k1  [R0603]
R9  2.2K  [R0603]
R10  10K  [R0603]
R11  2.2K  [R0603]
R12  2.7K  [R0603]
R13  2.2K  [R0603]
R14  2.2K  [R0603]
Servo  红色 LED  [0603 LED R]
U2  TPS542951PWPR  [SSOP16_EP]
U3  TPS5430  [LC-SOP-8_EP_150mil]
U4  RT9013-3.3  [SOT23-5N]
VIN  XT60电源输入接口  [XT60 母头 电源接口]
Vol  电压表 2.54接线端子  [XH2.54-LI-2P]

### Nets
GND: 3V3.2 5V.2 C12.2 C13.2 C14.1 C16.1 C17.1 C18.1 C19.1 C20.1 C21.1 C22.2 C23.1 C24.2 C25.2 C27.1 C28.1 C29.1 C30.1 C31.1 C32.1 C33.1 C35.1 C36.1 C37.1 C38.1 C43.2 C44.1 C45.1 C46.2 Cam.2 D1.1(A) R7.1 R8.1 R12.1 Servo.2 U2.4(PGND1) U2.8(GND) U2.13(PGND2) U2.21(EP) U3.0(gnd) U3.6(GND) U4.2(GND) VIN.2 Vol.2
VDD_3V3: C20.2 C21.2 L2.2 R4.1 R9.1
VDD_5V: C32.2 C33.2 C43.1 C44.2 L4.2 R6.1 R11.1 U4.1(IN) U4.3(EN)
VDD_CAM: C45.2 C46.1 R13.1 U4.5(OUT)
VDD_IN: C12.1 C13.1 C22.1 C24.1 C25.1 C35.2 C36.2 CPU_ON/OFF.2 CPU_ON/OFF.3 R3.2 R5.2 U2.1(VIN1) U2.16(VIN2) U3.7(VIN) Vol.1
VDD_Motor: Motor_ON/OFF.2 Motor_ON/OFF.3
VDD_Servo: C37.2 C38.2 L6.2 R10.2 R14.1
Net3V3_1: 3V3.1 R9.2
Net5V_1: 5V.1 R11.2
NetC14_2: C14.2 U2.6(SS1)
NetC15_1: C15.1 U2.2(VBST1)
NetC15_2: C15.2 L1.1 U2.3(SW1)
NetC16_2: C16.2 C17.2 C18.2 C19.2 L1.2 L2.1
NetC23_2: C23.2 U2.11(SS2)
NetC26_1: C26.1 U2.15(VBST2)
NetC26_2: C26.2 L3.1 U2.14(SW2)
NetC27_2: C27.2 U2.9(VREG)
NetC28_2: C28.2 C29.2 C30.2 C31.2 L3.2 L4.1
NetC34_1: C34.1 D1.2(K) L6.1 U3.8(PH)
NetC34_2: C34.2 U3.1(BOOT)
NetCam_1: Cam.1 R13.2
NetCPU_ON/OFF_1: CPU_ON/OFF.1 Motor_ON/OFF.1 VIN.1
NetR3_1: R3.1 U2.5(EN1)
NetR4_2: R4.2 R7.2 U2.7(VFB1)
NetR5_1: R5.1 U2.12(EN2)
NetR6_2: R6.2 R8.2 U2.10(VFB2)
NetR10_1: R10.1 R12.2 U3.4(VSENSE)
NetR14_2: R14.2 Servo.1

Not connected (* = marked no-connect by the designer): U3 5(ENA)*; U4 4(NC)*

### Notes on the sheet
- (near R12) 2.7K 为5.74V
  2.4K 为6.3V
- Labels drawn without touching a wire or pin: 5V_3V电源, 摄像头电源, 电源指示灯, 电源输入/电压表/开关, 舵机电源
- Title：
- Size:
- Project：
- A4
- Date:
- Revision:
- Author：
- Haibara
- Sheet:
- of:
- (in symbol CAP POL) +
- (in symbol Cap Pol2) 16V

### Library data of the parts
3V3 5V Cam Servo = 红灯: 发光二极管; ComponentLink1Description: 供应商链接; ComponentLink1URL: http://www.szlcsc.com/product/details_2668.html; Package: 0805; Supplier: LC; SuppliersPartNumber: C2295
C12-C21 C23-C38 = 电容
C22 = CAP POL: Capacitor
C43 C46 = Cap Pol2: Polarized Capacitor (Axial); Published: 8-Jun-2000; LatestRevisionDate: 17-Jul-2002; LatestRevisionNote: Re-released for DXP Platform.; PackageReference: POLAR0.8; Publisher: Altium Limited; PackageDescription: Polarized Capacitor; 2 Leads
C44 C45 = Cap: Capacitor; Published: 8-Jun-2000; LatestRevisionDate: 17-Jul-2002; LatestRevisionNote: Re-released for DXP Platform.; PackageReference: RAD-0.3; Publisher: Altium Limited; PackageDescription: Radial Cap, Thru-Hole; 2 Leads; 0.3 in Pin Spacing
CPU_ON/OFF Motor_ON/OFF = SW-SPDT: SPDT Subminiature Toggle Switch, Right Angle Mounting, Vertical Actuation; Published: 24-Mar-1999; LatestRevisionDate: 17-Dec-2003; LatestRevisionNote: Schematic revised, PCB Footprint replaced.; DatasheetVersion: 05-Dec-2000; PackageReference: TL36WW15050; Publisher: Altium Limited; PackageDescription: Switch; 4 Leads; ComponentLink1Description: Manufacturer Link; ComponentLink1URL: http://www.apem.com
D1 = 肖特基二极管: as D4 on sheet 04.Input_Output; Published: 8-Jun-2000; LatestRevisionDate: 17-Jul-2002; LatestRevisionNote: Re-released for DXP Platform.; DatasheetVersion: PD-2.057B; PackageVersion: Feb-1998; PackageReference: TO-220AC; Publisher: Altium Limited; PackageDescription: TO, Thru-Hole, Vertical, Heatsink Mounted; 3 In-Line Leads (1 Absent); Pitch 2.54 mm; ComponentLink1Description: Manufacturer Link; ComponentLink1URL: http://www.irf.com/; ComponentLink2Description: Datasheet; ComponentLink2URL: http://www.irf.com/product-info/datasheets/data/10tq.pdf
L1 L3 L6 = 电感
L2 L4 = 磁珠: BLM18PG471SN1D
R3-R14 = 电阻
U3 = TPS5410: 1-A, Wide Input Range, Step-Down Converter
U4 = RT9013-3.3: 3.3V电源芯片
VIN = 电机供电接口
Vol = Header 2: Header, 2-Pin; LatestRevisionDate: 17-Jul-2002; LatestRevisionNote: Re-released for DXP Platform.; Publisher: Altium Limited

## Sheet 05.Motor_Drive.schdoc: 05.Motor_Drive
size A4; Revision: V1; SheetNumber: 6; SheetTotal: 6; Project: CH32V307VCT6
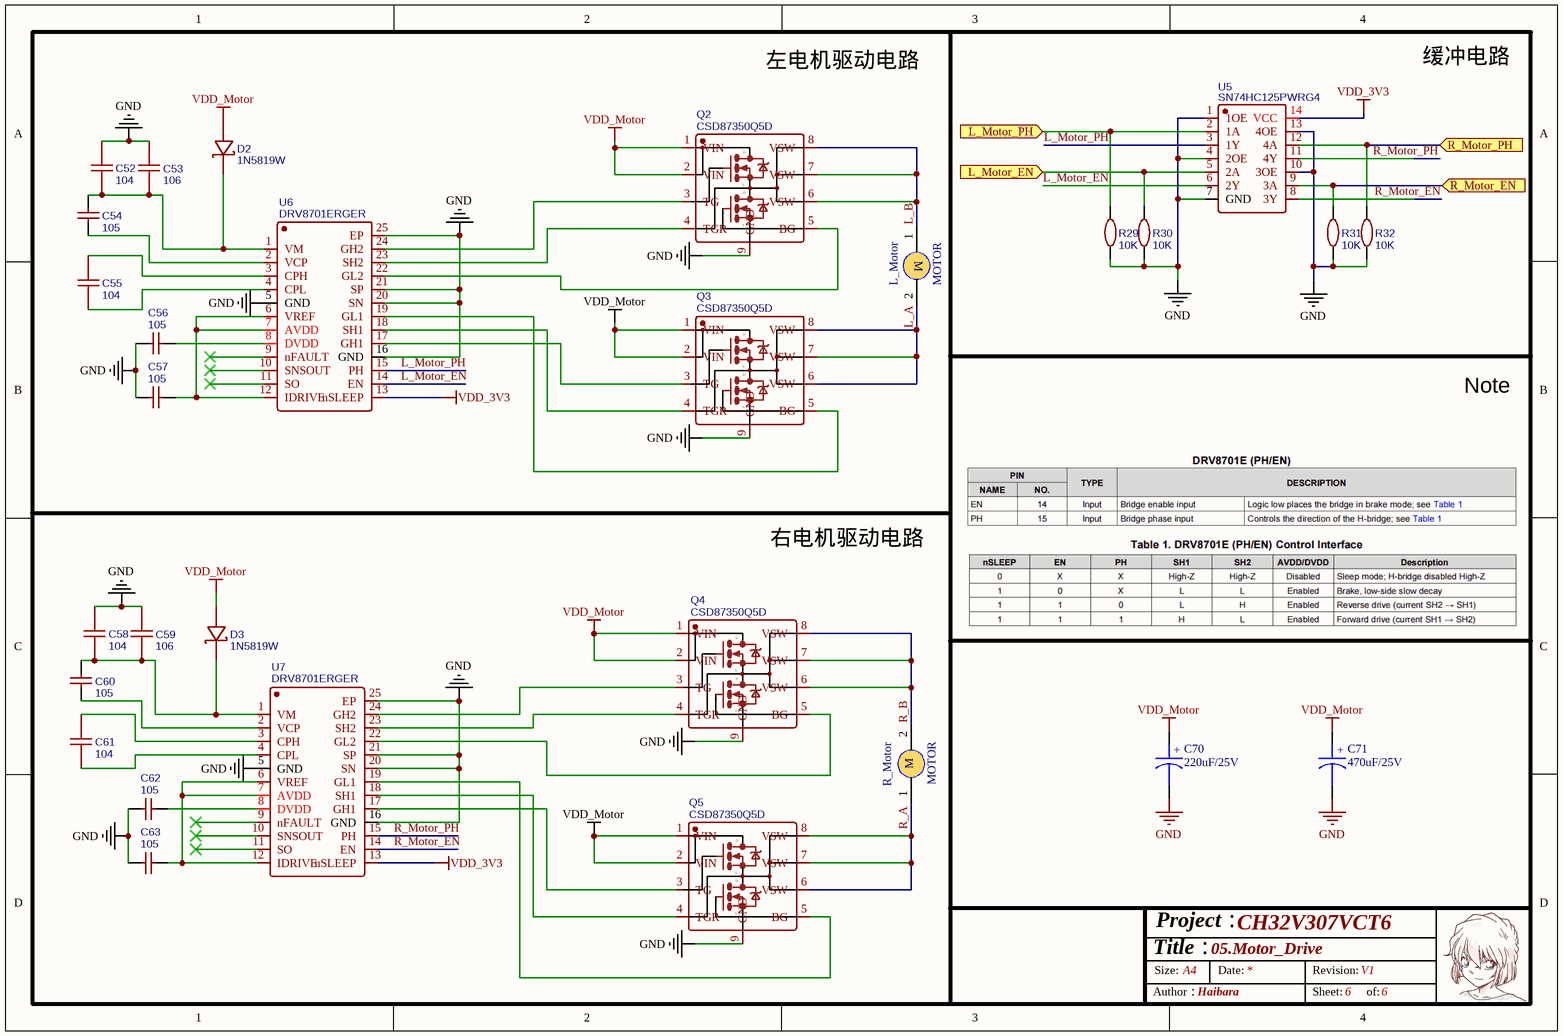
[diagram p5: 05.Motor_Drive.schdoc]

### Parts
C52  104  [C0603]
C53  106  [C0805]
C54  105  [C0603]
C55  104  [C0603]
C56  105  [C0603]
C57  105  [C0603]
C58  104  [C0603]
C59  106  [C0805]
C60  105  [C0603]
C61  104  [C0603]
C62  105  [C0603]
C63  105  [C0603]
C70  220uF/25V  [CAP 2.5*6.3*11.2]
C71  470uF/25V  [CAP 3.5*8*11.5 - BK]
D2  1N5819W  [SOD-123F_L2.8-W1.8-LS3.7-RD]
D3  1N5819W  [SOD-123F_L2.8-W1.8-LS3.7-RD]
L_Motor  MOTOR  [XT30 母头 电源插头]
Q2  CSD87350Q5D  [LSON-8_L6.0-W5.0-P1.27-LS6.0-TL-EP]
Q3  CSD87350Q5D  [LSON-8_L6.0-W5.0-P1.27-LS6.0-TL-EP]
Q4  CSD87350Q5D  [LSON-8_L6.0-W5.0-P1.27-LS6.0-TL-EP]
Q5  CSD87350Q5D  [LSON-8_L6.0-W5.0-P1.27-LS6.0-TL-EP]
R29  10K  [R0603]
R30  10K  [R0603]
R31  10K  [R0603]
R32  10K  [R0603]
R_Motor  MOTOR  [XT30 母头 电源插头]
U5  SN74HC125PWRG4  [TSSOP-14_L5.0-W4.4-P0.65-LS6.4-TL]
U6  DRV8701ERGER  [VQFN-24_L4.0-W4.0-P0.50-BL-EP2.8]
U7  DRV8701ERGER  [VQFN-24_L4.0-W4.0-P0.50-BL-EP2.8]

### Ports
L_Motor_EN (in), L_Motor_PH (in), R_Motor_EN (in), R_Motor_PH (in)

### Nets
GND: C52.2 C53.1 C56.2 C57.2 C58.2 C59.1 C62.2 C63.1 C70.2 C71.2 Q2.9(GND) Q3.9(GND) Q4.9(GND) Q5.9(GND) R29.1 R30.1 R31.1 R32.1 U5.1(1OE) U5.4(2OE) U5.7(GND) U5.10(3OE) U5.13(4OE) U6.5(GND) U6.16(GND) U6.20(SN) U6.21(SP) U6.25(EP) U7.5(GND) U7.16(GND) U7.20(SN) U7.21(SP) U7.25(EP)
VDD_3V3: U5.14(VCC) U6.13(nSLEEP) U7.13(nSLEEP)
VDD_Motor: C70.1 C71.1 D2.2 D3.2 Q2.1(VIN) Q2.2(VIN) Q3.1(VIN) Q3.2(VIN) Q4.1(VIN) Q4.2(VIN) Q5.1(VIN) Q5.2(VIN)
L_A: L_Motor.2 Q3.6(VSW) Q3.7(VSW) Q3.8(VSW)
L_B: L_Motor.1 Q2.6(VSW) Q2.7(VSW) Q2.8(VSW)
L_EN_PD14: R29.2 U5.2(1A) ; port L_Motor_PH
L_Motor_EN: U5.6(2Y) U6.14(EN)
L_Motor_PH: U5.3(1Y) U6.15(PH)
L_PH_PD13: R30.2 U5.5(2A) ; port L_Motor_EN
R_A: Q5.6(VSW) Q5.7(VSW) Q5.8(VSW) R_Motor.1
R_B: Q4.6(VSW) Q4.7(VSW) Q4.8(VSW) R_Motor.2
R_EN_PD12: R32.2 U5.12(4A) ; port R_Motor_PH
R_Motor_EN: U5.8(3Y) U7.14(EN)
R_Motor_PH: U5.11(4Y) U7.15(PH)
R_PH_PD11: R31.2 U5.9(3A) ; port R_Motor_EN
NetC52_1: C52.1 C53.2 C54.2 D2.1 U6.1(VM)
NetC54_1: C54.1 U6.2(VCP)
NetC55_1: C55.1 U6.4(CPL)
NetC55_2: C55.2 U6.3(CPH)
NetC56_1: C56.1 U6.8(DVDD)
NetC57_1: C57.1 U6.6(VREF) U6.7(AVDD) U6.12(IDRIVE)
NetC58_1: C58.1 C59.2 C60.2 D3.1 U7.1(VM)
NetC60_1: C60.1 U7.2(VCP)
NetC61_1: C61.1 U7.4(CPL)
NetC61_2: C61.2 U7.3(CPH)
NetC62_1: C62.1 U7.8(DVDD)
NetC63_2: C63.2 U7.6(VREF) U7.7(AVDD) U7.12(IDRIVE)
NetQ2_3: Q2.3(TG) U6.24(GH2)
NetQ2_4: Q2.4(TGR) U6.23(SH2)
NetQ2_5: Q2.5(BG) U6.22(GL2)
NetQ3_3: Q3.3(TG) U6.17(GH1)
NetQ3_4: Q3.4(TGR) U6.18(SH1)
NetQ3_5: Q3.5(BG) U6.19(GL1)
NetQ4_3: Q4.3(TG) U7.24(GH2)
NetQ4_4: Q4.4(TGR) U7.23(SH2)
NetQ4_5: Q4.5(BG) U7.22(GL2)
NetQ5_3: Q5.3(TG) U7.17(GH1)
NetQ5_4: Q5.4(TGR) U7.18(SH1)
NetQ5_5: Q5.5(BG) U7.19(GL1)

Not connected (* = marked no-connect by the designer): U6 9(nFAULT)* 10(SNSOUT)* 11(SO)*; U7 9(nFAULT)* 10(SNSOUT)* 11(SO)*

### Notes on the sheet
- 左电机驱动电路
- 缓冲电路
- Note
- 右电机驱动电路
- Title：
- Size:
- Project：
- A4
- Date:
- Revision:
- Author：
- Haibara
- Sheet:
- of:
- (in symbol CAP POL) +
- (in symbol MOTOR1) M

### Library data of the parts
C52 C55 C58 C61 = 0.1u: nameAlias: Value(F); Contributor: LCEDA_Lib; spicePre: C; spiceSymbolName: C_0603_US
C53 C59 = 10uF: BOM_Manufacturer: Huaxin S&T; BOM_Manufacturer Part: 0805F106Z160CT; nameAlias: Capacitance; Contributor: LCSC; BOM_Supplier: LCSC; BOM_Supplier Part: C303921; BOM_JLCPCB Part Class: Extended Part; spicePre: C; spiceSymbolName: 0805F106Z160CT
C54 C56 C57 C60 C62 C63 = 1uF: BOM_Manufacturer Part: CL10B105KO8NNNC; BOM_Manufacturer: SAMSUNG; nameAlias: Capacitance; BOM_Supplier: LCSC; BOM_Supplier Part: C59782; BOM_JLCPCB Part Class: Extended Part; spicePre: C; spiceSymbolName: CL10B105KO8NNNC
C70 C71 = CAP POL: Capacitor
D2 D3 = 1N5819W: BOM_Manufacturer: Shandong Jingdao Microelectronics; Contributor: LCSC; BOM_Supplier: LCSC; BOM_Supplier Part: C169540; BOM_Manufacturer Part: 1N5819W; BOM_JLCPCB Part Class: Extended Part; spicePre: D; spiceSymbolName: 1N5819W
L_Motor R_Motor = MOTOR1
Q2-Q5 = CSD87350Q5D: BOM_Manufacturer: Texas Instruments; Contributor: LCSC; BOM_Supplier: LCSC; BOM_Supplier Part: C140356; BOM_Manufacturer Part: CSD87350Q5D; BOM_JLCPCB Part Class: Extended Part; spicePre: Q; spiceSymbolName: CSD87350Q5D
R29-R32 = 10K: BOM_Manufacturer: YAGEO; BOM_Manufacturer Part: RT0603BRD0710KL; nameAlias: Resistance (Ohms); Resistance: 10kΩ; BOM_Supplier: LCSC; BOM_Supplier Part: C95204; BOM_JLCPCB Part Class: Extended Part; spicePre: R; spiceSymbolName: RT0603BRD0710KL
U5 = SN74HC125PWRG4: BOM_Manufacturer: TI(德州仪器); Contributor: LCSC; BOM_Supplier: LCSC; BOM_Supplier Part: C2676184; BOM_Manufacturer Part: SN74HC125PWRG4; BOM_JLCPCB Part Class: Extended Part; spicePre: U; spiceSymbolName: SN74HC125PWRG4
U6 U7 = DRV8701ERGER: BOM_Manufacturer: Texas Instruments; Contributor: LCSC; BOM_Supplier: LCSC; BOM_Supplier Part: C90964; BOM_Manufacturer Part: DRV8701ERGER; BOM_JLCPCB Part Class: Extended Part; spicePre: U; spiceSymbolName: DRV8701ERGER

## Nets that join several sheets
GND: 01.CH32V307VCT6_MCU (22 pins), 03.Communicate (16 pins), 04.Input_Output (27 pins), 02.Power_Uint (45 pins), 05.Motor_Drive (33 pins)
VDD_3V3: 01.CH32V307VCT6_MCU (15 pins), 03.Communicate (R19.1 R20.1 R22.1 R26.2), 04.Input_Output (8 pins), 02.Power_Uint (5 pins), 05.Motor_Drive (U5.14 U6.13 U7.13)
VDD_5V: 04.Input_Output (12 pins), 02.Power_Uint (9 pins)
VDD_CAM: 04.Input_Output (摄像头.1 摄像头.2), 02.Power_Uint (C45.2 C46.1 R13.1 U4.5)
VDD_Motor: 02.Power_Uint (Motor_ON/OFF.2 Motor_ON/OFF.3), 05.Motor_Drive (12 pins)
VDD_Servo: 04.Input_Output (D4.1), 02.Power_Uint (5 pins)
ADC0_PA0: 01.CH32V307VCT6_MCU (U1.23), 04.Input_Output (A-电磁采集-B.14)
ADC1_PA1: 01.CH32V307VCT6_MCU (U1.24), 04.Input_Output (A-电磁采集-B.8)
ADC7_PA7: 01.CH32V307VCT6_MCU (U1.32), 04.Input_Output (A-电磁采集-B.19)
ADC8_PB0: 01.CH32V307VCT6_MCU (U1.35), 04.Input_Output (A-电磁采集-B.13)
ADC9_PB1: 01.CH32V307VCT6_MCU (U1.36), 04.Input_Output (A-电磁采集-B.7)
ADC11_PC1: 01.CH32V307VCT6_MCU (U1.16), 04.Input_Output (A-电磁采集-B.20)
ADC12_PC2: 01.CH32V307VCT6_MCU (U1.17), 04.Input_Output (A-电磁采集-B.16)
ADC13_PC3: 01.CH32V307VCT6_MCU (U1.18), 04.Input_Output (A-电磁采集-B.18)
ADC14_PC4: 01.CH32V307VCT6_MCU (U1.33), 04.Input_Output (A-电磁采集-B.17)
ADC15_PC5: 01.CH32V307VCT6_MCU (U1.34), 04.Input_Output (A-电磁采集-B.15)
BUZZER_PE1: 01.CH32V307VCT6_MCU (U1.98), 03.Communicate (R27.1 R28.1)
CAM_PA4: 01.CH32V307VCT6_MCU (U1.29), 04.Input_Output (摄像头.14)
CAM_PA5: 01.CH32V307VCT6_MCU (U1.30), 04.Input_Output (摄像头.13)
CAM_PA6: 01.CH32V307VCT6_MCU (U1.31), 04.Input_Output (摄像头.18)
CAM_PA9: 01.CH32V307VCT6_MCU (U1.68), 04.Input_Output (摄像头.11)
CAM_PA10: 01.CH32V307VCT6_MCU (U1.69), 04.Input_Output (摄像头.10)
CAM_PB6: 01.CH32V307VCT6_MCU (U1.92), 04.Input_Output (摄像头.6)
CAM_PB8: 01.CH32V307VCT6_MCU (U1.95), 04.Input_Output (摄像头.5)
CAM_PB9: 01.CH32V307VCT6_MCU (U1.96), 04.Input_Output (摄像头.4)
CAM_PC8: 01.CH32V307VCT6_MCU (U1.65), 04.Input_Output (摄像头.9)
CAM_PC9: 01.CH32V307VCT6_MCU (U1.66), 04.Input_Output (摄像头.8)
CAM_PC11: 01.CH32V307VCT6_MCU (U1.79), 04.Input_Output (摄像头.7)
DIP_SWITCH_PE7: 01.CH32V307VCT6_MCU (U1.38), 03.Communicate (R16.1)
DIP_SWITCH_PE8: 01.CH32V307VCT6_MCU (U1.39), 03.Communicate (R17.1)
DIP_SWITCH_PE10: 01.CH32V307VCT6_MCU (U1.41), 03.Communicate (R18.1)
DIP_SWITCH_PE12: 01.CH32V307VCT6_MCU (U1.43), 03.Communicate (R15.1)
Hallwee_PD3: 01.CH32V307VCT6_MCU (U1.84), 04.Input_Output (Hallwee.2)
IMU_PB3: 01.CH32V307VCT6_MCU (U1.89), 04.Input_Output (陀螺仪.3)
IMU_PB4: 01.CH32V307VCT6_MCU (U1.90), 04.Input_Output (陀螺仪.5)
IMU_PB5: 01.CH32V307VCT6_MCU (U1.91), 04.Input_Output (陀螺仪.4)
IMU_PE4: 01.CH32V307VCT6_MCU (U1.3), 04.Input_Output (陀螺仪.6)
IPS_PB7: 01.CH32V307VCT6_MCU (U1.93), 04.Input_Output (IPS.8)
IPS_PB13: 01.CH32V307VCT6_MCU (U1.52), 04.Input_Output (IPS.3)
IPS_PB15: 01.CH32V307VCT6_MCU (U1.54), 04.Input_Output (IPS.4)
IPS_PD0: 01.CH32V307VCT6_MCU (U1.81), 04.Input_Output (IPS.5)
IPS_PD4: 01.CH32V307VCT6_MCU (U1.85), 04.Input_Output (IPS.6)
IPS_PD7: 01.CH32V307VCT6_MCU (U1.88), 04.Input_Output (IPS.7)
L_EN_PD14: 01.CH32V307VCT6_MCU (U1.61), 05.Motor_Drive (R29.2 U5.2)
L_ENC_PA2: 01.CH32V307VCT6_MCU (U1.25), 04.Input_Output (编码器左.3)
L_ENC_PA3: 01.CH32V307VCT6_MCU (U1.26), 04.Input_Output (编码器左.4)
L_PH_PD13: 01.CH32V307VCT6_MCU (U1.60), 05.Motor_Drive (R30.2 U5.5)
LED_B_PB10: 01.CH32V307VCT6_MCU (U1.47), 03.Communicate (BLUE.2)
LED_G_PB11: 01.CH32V307VCT6_MCU (U1.48), 03.Communicate (GREEN.2)
LED_R_PB12: 01.CH32V307VCT6_MCU (U1.51), 03.Communicate (RED.2)
R_EN_PD12: 01.CH32V307VCT6_MCU (U1.59), 05.Motor_Drive (R32.2 U5.12)
R_ENC_PE9: 01.CH32V307VCT6_MCU (U1.40), 04.Input_Output (编码器右.3)
R_ENC_PE11: 01.CH32V307VCT6_MCU (U1.42), 04.Input_Output (编码器右.4)
R_PH_PD11: 01.CH32V307VCT6_MCU (U1.58), 05.Motor_Drive (R31.2 U5.9)
Servo_PD15: 01.CH32V307VCT6_MCU (U1.62), 04.Input_Output (舵机.1)
SWITCH_PE2: 01.CH32V307VCT6_MCU (U1.1), 03.Communicate (R21.1)
SWITCH_PE3: 01.CH32V307VCT6_MCU (U1.2), 03.Communicate (R23.1)
SWITCH_PE5: 01.CH32V307VCT6_MCU (U1.4), 03.Communicate (R24.1)
SWITCH_PE6: 01.CH32V307VCT6_MCU (U1.5), 03.Communicate (R25.1)
UART2_RX_PD6: 01.CH32V307VCT6_MCU (U1.87), 04.Input_Output (USART_A.3)
UART2_TX_PD5: 01.CH32V307VCT6_MCU (U1.86), 04.Input_Output (USART_A.4)
UART3_RTS_B14: 01.CH32V307VCT6_MCU (U1.53), 04.Input_Output (无线串口.4)
UART3_RX_D9: 01.CH32V307VCT6_MCU (U1.56), 04.Input_Output (无线串口.3)
UART3_TX_D8: 01.CH32V307VCT6_MCU (U1.55), 04.Input_Output (无线串口.1)
UART5_RX_PD2: 01.CH32V307VCT6_MCU (U1.83), 04.Input_Output (摄像头.16)
UART5_TX_PC12: 01.CH32V307VCT6_MCU (U1.80), 04.Input_Output (摄像头.15)
UART8_RX_PE15: 01.CH32V307VCT6_MCU (U1.46), 04.Input_Output (USART_B.3)
UART8_TX_PE14: 01.CH32V307VCT6_MCU (U1.45), 04.Input_Output (USART_B.4)